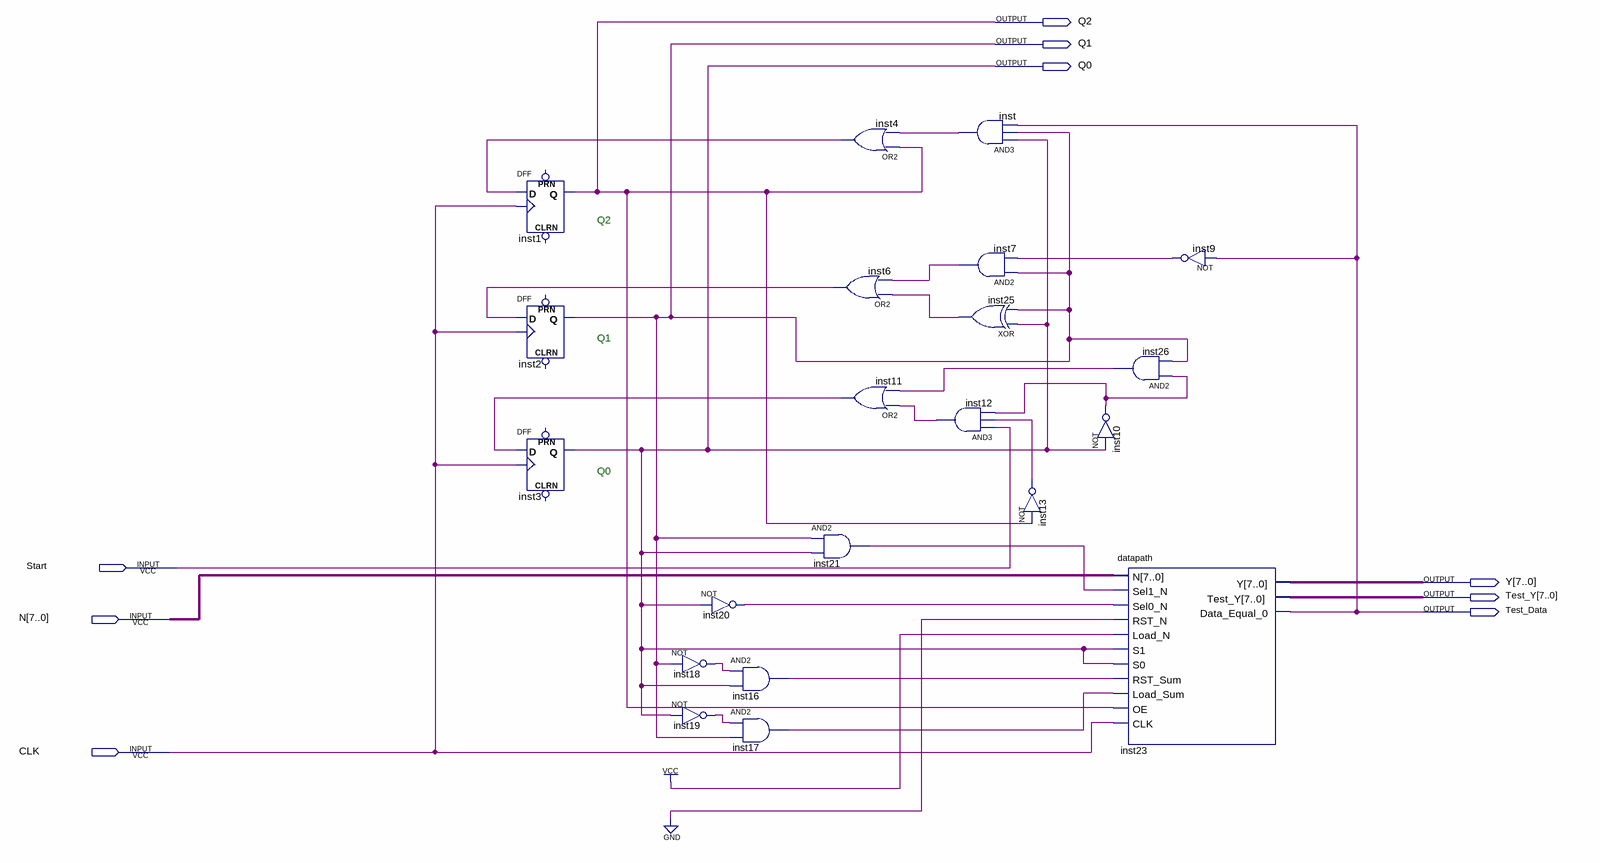
[diagram p0: schematic sheet]
// Quartus schematic cau01_resolve.bdf as structural Verilog: 21 symbols, 9 pins
module cau01_resolve (
  input  Start,
  input  [7:0] N,
  input  CLK,
  output Q2,
  output Q1,
  output Q0,
  output [7:0] Y,
  output [7:0] Test_Y,
  output Test_Data
);

  wire inst4_out, inst6_out, inst7_out, inst9_out, inst10_out, inst11_out, inst12_out, inst13_out,
       inst16_out, inst17_out, inst18_out, inst19_out, inst20_out, inst21_out, inst25_out, inst26_out,
       inst_out;

  DFF inst1 (.CLK(CLK), .D(inst4_out), .Q(Q2));  // open: CLRN, PRN
  DFF inst2 (.CLK(CLK), .D(inst6_out), .Q(Q1));  // open: CLRN, PRN
  DFF inst3 (.CLK(CLK), .D(inst11_out), .Q(Q0));  // open: CLRN, PRN
  not inst20 (inst20_out, Q0);
  not inst18 (inst18_out, Q1);
  not inst19 (inst19_out, Q0);
  and inst16 (inst16_out, inst18_out, Q0);
  and inst17 (inst17_out, inst19_out, Q1);
  and inst21 (inst21_out, Q1, Q0);
  or inst4 (inst4_out, Q2, inst_out);
  or inst6 (inst6_out, inst25_out, inst7_out);
  or inst11 (inst11_out, inst12_out, inst26_out);
  and inst12 (inst12_out, Start, inst13_out, inst10_out);
  and inst (inst_out, Q0, Q1, Test_Data);
  and inst7 (inst7_out, Q1, inst9_out);
  xor inst25 (inst25_out, Q0, Q1);
  not inst13 (inst13_out, Q2);
  and inst26 (inst26_out, inst10_out, Q1);
  not inst10 (inst10_out, Q0);
  datapath inst23 (
    .RST_Sum(inst16_out), .RST_N(1'b0), .S0(Q0), .Load_Sum(inst17_out), .OE(Q2), .Load_N(1'b1), .S1(Q0),
    .Sel0_N(inst20_out), .Sel1_N(inst21_out), .N(N), .CLK(CLK), .Y(Y), .Test_Y(Test_Y),
    .Data_Equal_0(Test_Data));
  not inst9 (inst9_out, Test_Data);

  // Notes on the sheet:
  //   Q2
  //   Q1
  //   Q0
endmodule
